# Altium schematic sheet eSpark Template.SchDoc: =Projectname
size A4
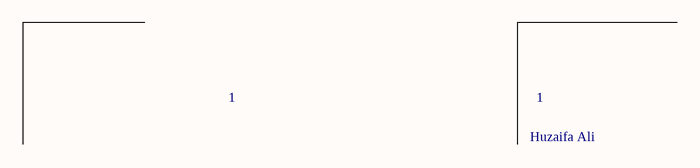
[diagram p0: eSpark Template.SchDoc]

## Notes on the sheet
- 1
- Huzaifa Ali